# Altium schematic sheet Controller_Accessories.SchDoc
size Letter; Organization: Cegep Limoilou; Address1: 1300, 8e Avenue; Address2: Québec, QC; Address3: Canada; Address4: G1J 5L5; Revision: A; SheetNumber: 2; SheetTotal: 2; Conception: Xavier Champoux; Titre: Télécommande KJ Turret; Modification: Xavier Champoux
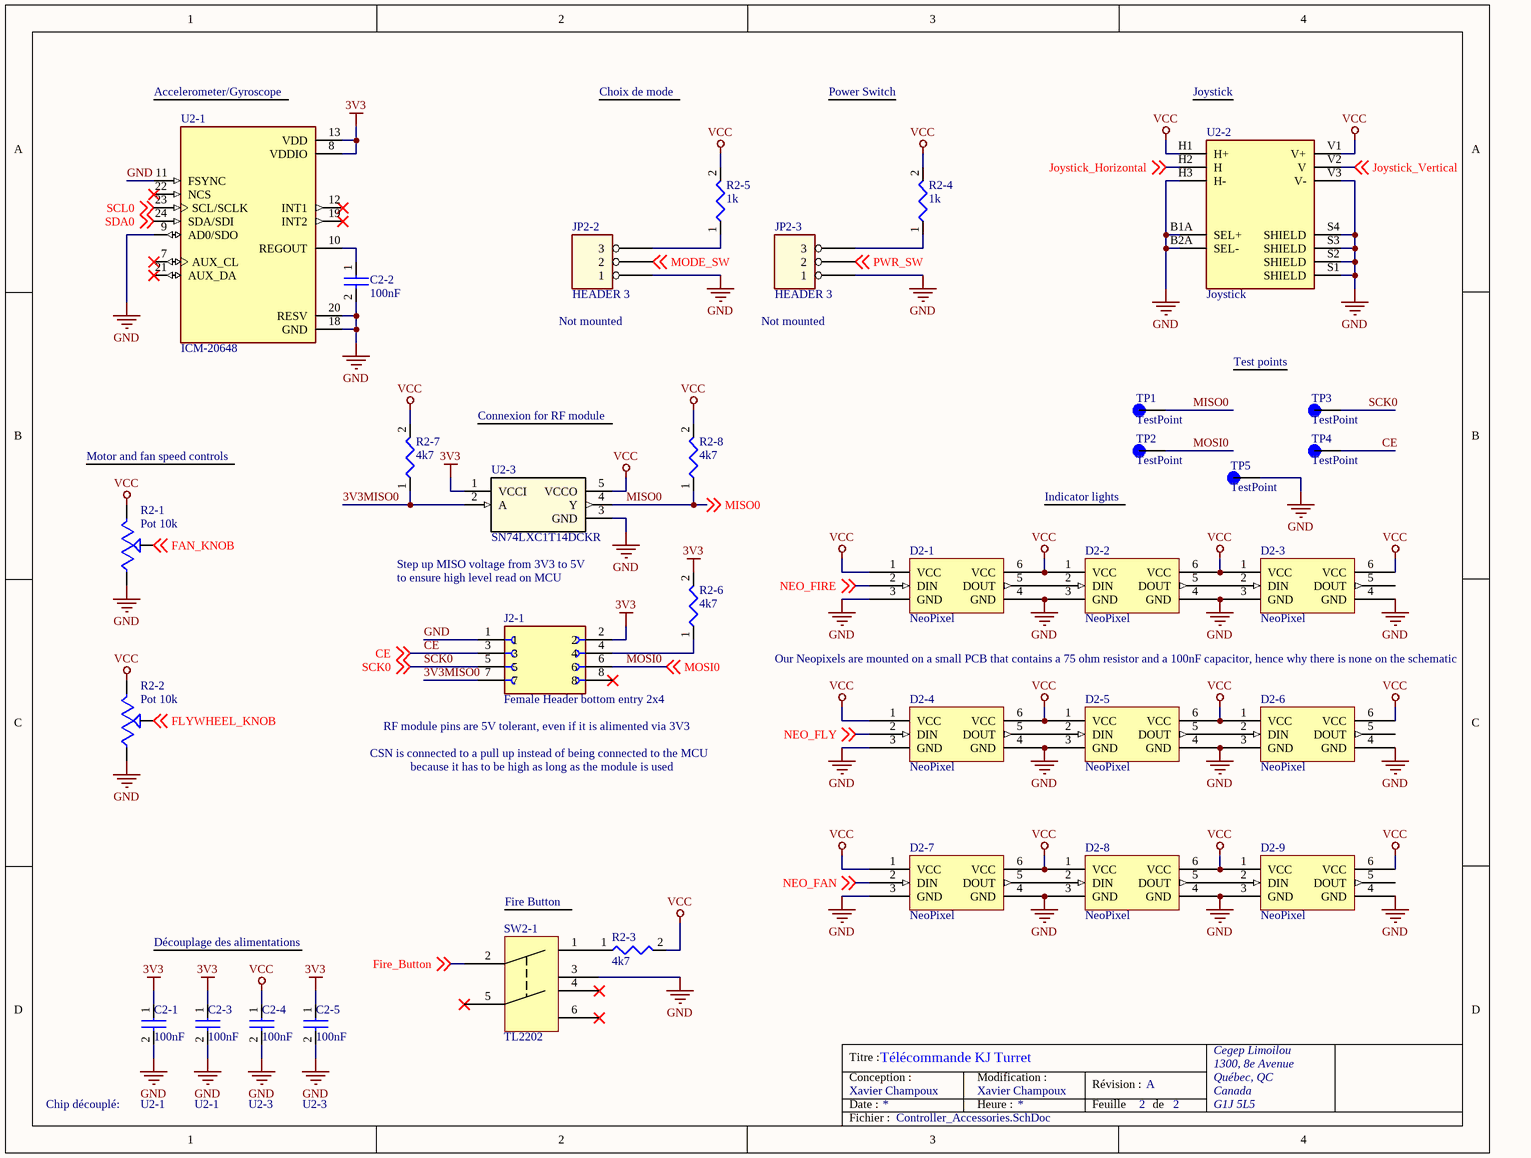
[diagram p0: Controller_Accessories.SchDoc]

## Parts
C2-1  100nF  [0805_SMD]
C2-2  100nF  [0805_SMD]
C2-3  100nF  [0805_SMD]
C2-4  100nF  [0805_SMD]
C2-5  100nF  [0805_SMD]
D2-1  NeoPixel  [NeoPixel]
D2-2  NeoPixel  [NeoPixel]
D2-3  NeoPixel  [NeoPixel]
D2-4  NeoPixel  [NeoPixel]
D2-5  NeoPixel  [NeoPixel]
D2-6  NeoPixel  [NeoPixel]
D2-7  NeoPixel  [NeoPixel]
D2-8  NeoPixel  [NeoPixel]
D2-9  NeoPixel  [NeoPixel]
J2-1  Female Header bottom entry 2x4  [AMPHENOL_71991-306LF]
JP2-2  HEADER 3  [Header 3]
JP2-3  HEADER 3  [Header 3]
R2-1  Pot 10k  [TRIM_PT01-D120K2-B103]
R2-2  Pot 10k  [TRIM_PT01-D120K2-B103]
R2-3  4k7  [0805_SMD]
R2-4  1k  [0805_SMD]
R2-5  1k  [0805_SMD]
R2-6  4k7  [0805_SMD]
R2-7  4k7  [0805_SMD]
R2-8  4k7  [0805_SMD]
SW2-1  TL2202  [TL2202]
TP1  TestPoint  [KEYSTONE_5006]
TP2  TestPoint  [KEYSTONE_5006]
TP3  TestPoint  [KEYSTONE_5006]
TP4  TestPoint  [KEYSTONE_5006]
TP5  TestPoint  [KEYSTONE_5006]
U2-1  ICM-20648  [QFN40P300X300X95-24N]
U2-2  Joystick  [XDCR_COM-09032]
U2-3  SN74LXC1T14DCKR  [DCK0005A-IPC_A]

## Nets
3V3: C2-1.1 C2-3.1 C2-5.1 J2-1.2 R2-6.2 U2-1.8(VDDIO) U2-1.13(VDD) U2-3.1(VCCI)
GND: C2-1.2 C2-2.2 C2-3.2 C2-4.2 C2-5.2 D2-1.3(GND) D2-1.4(GND) D2-2.3(GND) D2-2.4(GND) D2-3.3(GND) D2-3.4(GND) D2-4.3(GND) D2-4.4(GND) D2-5.3(GND) D2-5.4(GND) D2-6.3(GND) D2-6.4(GND) D2-7.3(GND) D2-7.4(GND) D2-8.3(GND) D2-8.4(GND) D2-9.3(GND) D2-9.4(GND) J2-1.1 JP2-2.1 JP2-3.1 R2-1.3 R2-2.3 SW2-1.3 TP5.TP U2-1.9(AD0/SDO) U2-1.11(FSYNC) U2-1.18(GND) U2-1.20(RESV) U2-2.B1A(SEL+) U2-2.B2A(SEL-) U2-2.H3(H-) U2-2.S1(SHIELD) U2-2.S2(SHIELD) U2-2.S3(SHIELD) U2-2.S4(SHIELD) U2-2.V3(V-) U2-3.3(GND)
VCC: C2-4.1 D2-1.1(VCC) D2-1.6(VCC) D2-2.1(VCC) D2-2.6(VCC) D2-3.1(VCC) D2-3.6(VCC) D2-4.1(VCC) D2-4.6(VCC) D2-5.1(VCC) D2-5.6(VCC) D2-6.1(VCC) D2-6.6(VCC) D2-7.1(VCC) D2-7.6(VCC) D2-8.1(VCC) D2-8.6(VCC) D2-9.1(VCC) D2-9.6(VCC) R2-1.1 R2-2.1 R2-3.2 R2-4.2 R2-5.2 R2-7.2 R2-8.2 U2-2.H1(H+) U2-2.V1(V+) U2-3.5(VCCO)
3V3MISO0: J2-1.7 R2-7.1 U2-3.2(A)
CE: J2-1.3 TP4.TP ; off-sheet CE
FAN_KNOB: R2-1.2 ; off-sheet FAN_KNOB
Fire_Button: SW2-1.2 ; off-sheet Fire_Button
FLYWHEEL_KNOB: R2-2.2 ; off-sheet FLYWHEEL_KNOB
Joystick_Horizontal: U2-2.H2(H) ; off-sheet Joystick_Horizontal
Joystick_Vertical: U2-2.V2(V) ; off-sheet Joystick_Vertical
MISO0: R2-8.1 TP1.TP U2-3.4(Y) ; off-sheet MISO0
MODE_SW: JP2-2.2 ; off-sheet MODE_SW
MOSI0: J2-1.6 TP2.TP ; off-sheet MOSI0
NEO_FAN: D2-7.2(DIN) ; off-sheet NEO_FAN
NEO_FIRE: D2-1.2(DIN) ; off-sheet NEO_FIRE
NEO_FLY: D2-4.2(DIN) ; off-sheet NEO_FLY
PWR_SW: JP2-3.2 ; off-sheet PWR_SW
SCK0: J2-1.5 TP3.TP ; off-sheet SCK0
SCL0: U2-1.23(SCL/SCLK) ; off-sheet SCL0
SDA0: U2-1.24(SDA/SDI) ; off-sheet SDA0
NetC2-2_1: C2-2.1 U2-1.10(REGOUT)
NetD2-1_5: D2-1.5(DOUT) D2-2.2(DIN)
NetD2-2_5: D2-2.5(DOUT) D2-3.2(DIN)
NetD2-4_5: D2-4.5(DOUT) D2-5.2(DIN)
NetD2-5_5: D2-5.5(DOUT) D2-6.2(DIN)
NetD2-7_5: D2-7.5(DOUT) D2-8.2(DIN)
NetD2-8_5: D2-8.5(DOUT) D2-9.2(DIN)
NetJ2-1_4: J2-1.4 R2-6.1
NetJP2-2_3: JP2-2.3 R2-5.1
NetJP2-3_3: JP2-3.3 R2-4.1
NetR2-3_1: R2-3.1 SW2-1.1

Not connected (* = marked no-connect by the designer): D2-3 5(DOUT); D2-6 5(DOUT); D2-9 5(DOUT); J2-1 8*; SW2-1 4* 5* 6*; U2-1 7(AUX_CL)* 12(INT1)* 19(INT2)* 21(AUX_DA)* 22(NCS)*

## Notes on the sheet
- (near U2-1) Accelerometer/Gyroscope
- Choix de mode
- Power Switch
- Joystick
- (near JP2-2) Not mounted
- (near JP2-3) Not mounted
- (near TP3) Test points
- Connexion for RF module
- Motor and fan speed controls
- (near TP2) Indicator lights
- (near U2-3) Step up MISO voltage from 3V3 to 5V
- to ensure high level read on MCU
- Our Neopixels are mounted on a small PCB that contains a 75 ohm resistor and a 100nF capacitor, hence why there is none on the schematic
- CSN is connected to a pull up instead of being connected to the MCU
- (near J2-1) RF module pins are 5V tolerant, even if it is alimented via 3V3
- because it has to be high as long as the module is used
- Fire Button
- Découplage des alimentations
- Chip découplé:
- U2-1
- U2-3
- Titre :
- Conception :
- Date :
- Modification :
- Heure :
- Révision :
- Feuille
- de
- Fichier :

## Library data of the parts
C2-1-C2-5 = CAP NP
J2-1 = Female Header bottom entry 2x4: MF: Amphenol; MP: 71991-306LF; Package: None; Price: None; Check_prices: https://www.snapeda.com/parts/71991-306LF/Amphenol/view-part/?ref=eda; Value: *; SnapEDA_Link: https://www.snapeda.com/parts/71991-306LF/Amphenol/view-part/?ref=snap; Availability: In Stock; Purchase-URL: https://pricing.snapeda.com/search?q=71991-306LF&ref=eda
R2-1 R2-2 = Potentiometer knob: MP: PT01-D120K2-B103; Value: *; Availability: Unavailable; Package: None; Price: None
R2-3-R2-8 = R
TP1-TP5 = TestPoint: MF: Keystone Electronics Corp.; MP: 5006; SnapEDA_Link: https://www.snapeda.com/parts/5006/Keystone/view-part/?ref=snap; Package: NON STANDARD-1 Keystone; Value: *; Check_prices: https://www.snapeda.com/parts/5006/Keystone/view-part/?ref=eda
U2-1 = ICM-20648: MF: TDK InvenSense; MP: ICM-20648; Package: QFN-24 InvenSense; Price: None; Value: *; SnapEDA_Link: https://www.snapeda.com/parts/ICM-20648/TDK%20InvenSense/view-part/474513/?ref=snap; Availability: Unavailable
U2-2 = Joystick: MP: COM-09032; Price: None; Availability: Unavailable; Value: *; Package: None
U2-3 = SN74LXC1T14DCKR: Mfr_Name: Texas Instruments; TYPE: TYPE; RefDes: RefDes